# Altium schematic sheet Headers.SchDoc: Skipper Headers
size 297 x 210 mm; Author: Jack Herron; SheetNumber: 4; SheetTotal: 11
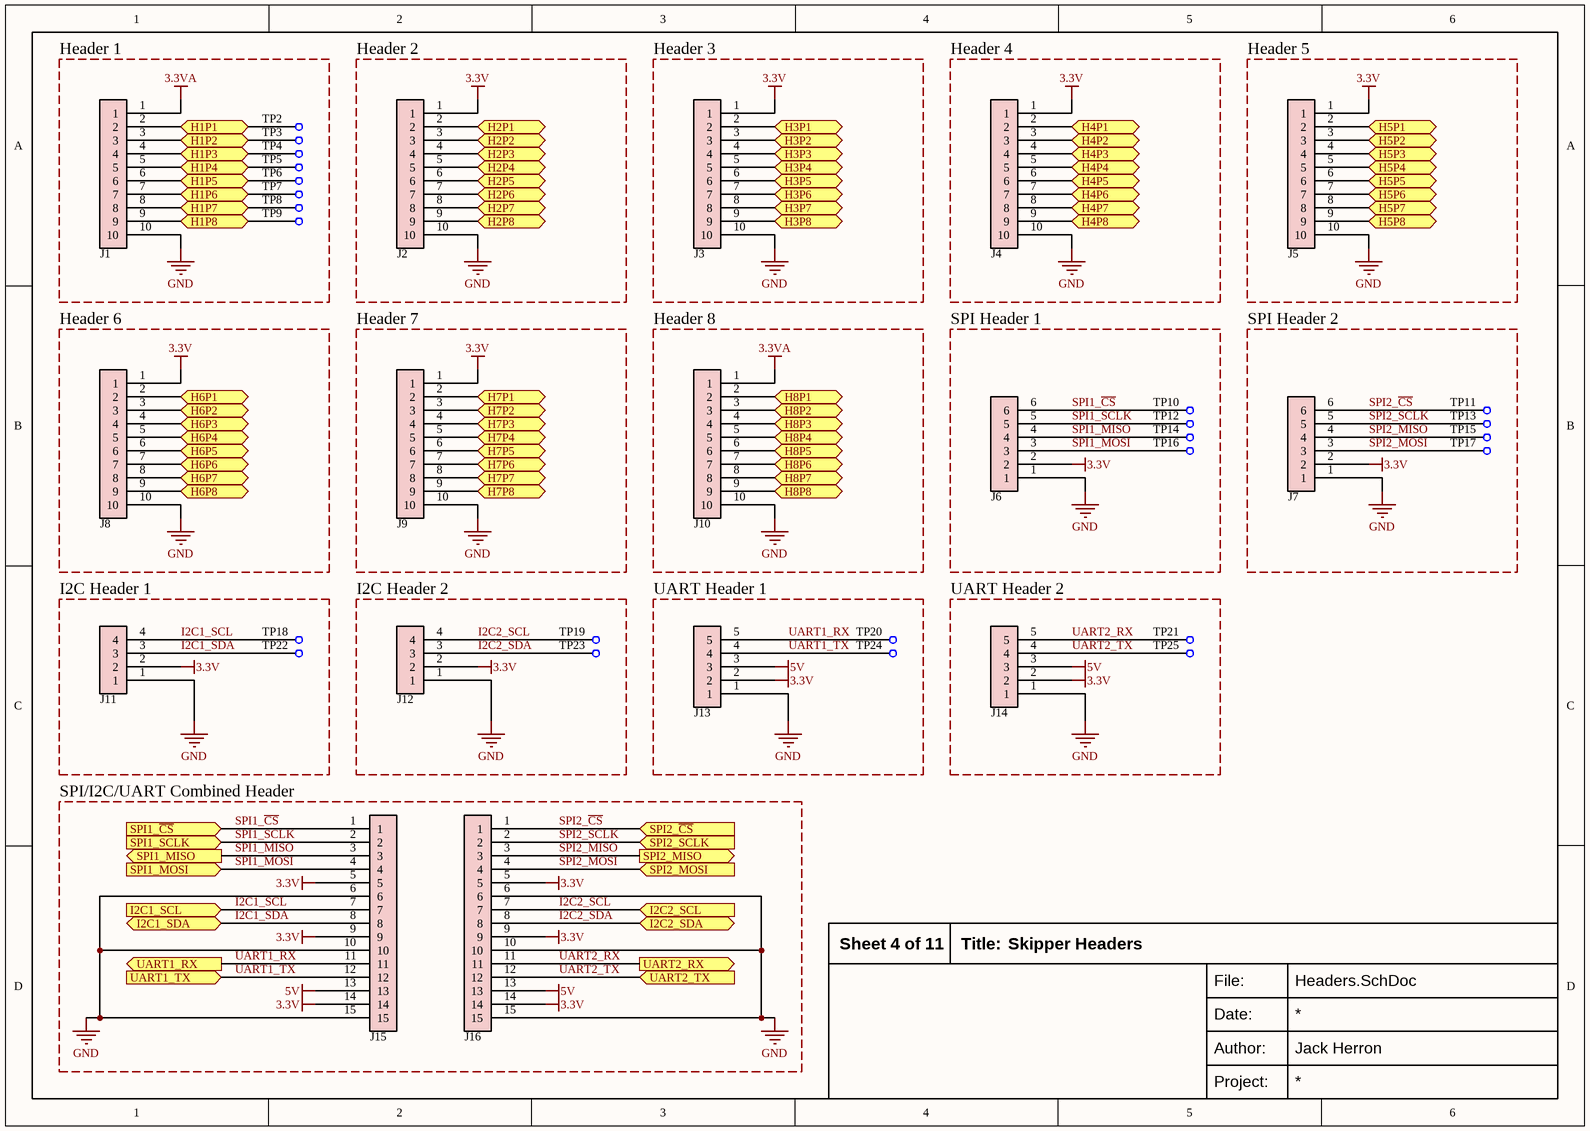
[diagram p0: Headers.SchDoc]

## Parts
J1  PM254-1-10-Z-8.5  [CONNECTOR_Female-header_1x10_2.54mm_PM254-1-10-Z-8.5_NOSILK]  (value not drawn)
J2  PM254-1-10-Z-8.5  [CONNECTOR_Female-header_1x10_2.54mm_PM254-1-10-Z-8.5_NOSILK]  (value not drawn)
J3  PM254-1-10-Z-8.5  [CONNECTOR_Female-header_1x10_2.54mm_PM254-1-10-Z-8.5_NOSILK]  (value not drawn)
J4  PM254-1-10-Z-8.5  [CONNECTOR_Female-header_1x10_2.54mm_PM254-1-10-Z-8.5_NOSILK]  (value not drawn)
J5  PM254-1-10-Z-8.5  [CONNECTOR_Female-header_1x10_2.54mm_PM254-1-10-Z-8.5_NOSILK]  (value not drawn)
J6  Connector - 6pin - 1mm  [CONNECTOR_HC-1.0-6PLT]  (value not drawn)
J7  Connector - 6pin - 1mm  [CONNECTOR_HC-1.0-6PLT]  (value not drawn)
J8  PM254-1-10-Z-8.5  [CONNECTOR_Female-header_1x10_2.54mm_PM254-1-10-Z-8.5_NOSILK]  (value not drawn)
J9  PM254-1-10-Z-8.5  [CONNECTOR_Female-header_1x10_2.54mm_PM254-1-10-Z-8.5_NOSILK]  (value not drawn)
J10  PM254-1-10-Z-8.5  [CONNECTOR_Female-header_1x10_2.54mm_PM254-1-10-Z-8.5_NOSILK]  (value not drawn)
J11  Connector - 4pin - 1mm  [CONNECTOR_HC-1.0-4PLT]  (value not drawn)
J12  Connector - 4pin - 1mm  [CONNECTOR_HC-1.0-4PLT]  (value not drawn)
J13  Connector - 5pin - 1mm  [CONNECTOR_HC-1.0-5PLT]  (value not drawn)
J14  Connector - 5pin - 1mm  [CONNECTOR_HC-1.0-5PLT]  (value not drawn)
J15  PM254-1-15-Z-8.5  [CONNECTOR_PM254-1-15-Z-8.5]  (value not drawn)
J16  PM254-1-15-Z-8.5  [CONNECTOR_PM254-1-15-Z-8.5]  (value not drawn)
TP2  RH-5019  [TESTPOINT_RH-5019]  (value not drawn)
TP3  RH-5019  [TESTPOINT_RH-5019]  (value not drawn)
TP4  RH-5019  [TESTPOINT_RH-5019]  (value not drawn)
TP5  RH-5019  [TESTPOINT_RH-5019]  (value not drawn)
TP6  RH-5019  [TESTPOINT_RH-5019]  (value not drawn)
TP7  RH-5019  [TESTPOINT_RH-5019]  (value not drawn)
TP8  RH-5019  [TESTPOINT_RH-5019]  (value not drawn)
TP9  RH-5019  [TESTPOINT_RH-5019]  (value not drawn)
TP10  RH-5019  [TESTPOINT_RH-5019]  (value not drawn)
TP11  RH-5019  [TESTPOINT_RH-5019]  (value not drawn)
TP12  RH-5019  [TESTPOINT_RH-5019]  (value not drawn)
TP13  RH-5019  [TESTPOINT_RH-5019]  (value not drawn)
TP14  RH-5019  [TESTPOINT_RH-5019]  (value not drawn)
TP15  RH-5019  [TESTPOINT_RH-5019]  (value not drawn)
TP16  RH-5019  [TESTPOINT_RH-5019]  (value not drawn)
TP17  RH-5019  [TESTPOINT_RH-5019]  (value not drawn)
TP18  RH-5019  [TESTPOINT_RH-5019]  (value not drawn)
TP19  RH-5019  [TESTPOINT_RH-5019]  (value not drawn)
TP20  RH-5019  [TESTPOINT_RH-5019]  (value not drawn)
TP21  RH-5019  [TESTPOINT_RH-5019]  (value not drawn)
TP22  RH-5019  [TESTPOINT_RH-5019]  (value not drawn)
TP23  RH-5019  [TESTPOINT_RH-5019]  (value not drawn)
TP24  RH-5019  [TESTPOINT_RH-5019]  (value not drawn)
TP25  RH-5019  [TESTPOINT_RH-5019]  (value not drawn)

## Blocks framed on the sheet
Header 1: J1 TP2-TP9
Header 2: J2
Header 3: J3
Header 4: J4
Header 5: J5
Header 6: J8
Header 7: J9
Header 8: J10
SPI Header 1: J6 TP10 TP12 TP14 TP16
SPI Header 2: J7 TP11 TP13 TP15 TP17
I2C Header 1: J11 TP18 TP22
I2C Header 2: J12 TP19 TP23
UART Header 1: J13 TP20 TP24
UART Header 2: J14 TP21 TP25
SPI/I2C/UART Combined Header: J15 J16

## Ports
H1P1 (bidir, see Top_Sheet[2A]), H1P2 (bidir, see Top_Sheet[2A]), H1P3 (bidir, see Top_Sheet[2A]), H1P4 (bidir, see Top_Sheet[3A]), H1P5 (bidir, see Top_Sheet[3A]), H1P6 (bidir, see Top_Sheet[3A]), H1P7 (bidir, see Top_Sheet[3A]), H1P8 (bidir, see Top_Sheet[3A]), H2P1 (bidir, see Top_Sheet[3A]), H2P2 (bidir, see Top_Sheet[3A]), H2P3 (bidir, see Top_Sheet[3A]), H2P4 (bidir, see Top_Sheet[3A]), H2P5 (bidir, see Top_Sheet[3A]), H2P6 (bidir, see Top_Sheet[3A]), H2P7 (bidir, see Top_Sheet[3A]), H2P8 (bidir, see Top_Sheet[3A]), H3P1 (bidir, see Top_Sheet[3A]), H3P2 (bidir, see Top_Sheet[3A]), H3P3 (bidir, see Top_Sheet[3A]), H3P4 (bidir, see Top_Sheet[3A]), H3P5 (bidir, see Top_Sheet[3A]), H3P6 (bidir, see Top_Sheet[4A]), H3P7 (bidir, see Top_Sheet[4A]), H3P8 (bidir, see Top_Sheet[4A]), H4P1 (bidir, see Top_Sheet[4A]), H4P2 (bidir, see Top_Sheet[4A]), H4P3 (bidir, see Top_Sheet[4A]), H4P4 (bidir, see Top_Sheet[4A]), H4P5 (bidir, see Top_Sheet[4A]), H4P6 (bidir, see Top_Sheet[4A]), H4P7 (bidir, see Top_Sheet[4A]), H4P8 (bidir, see Top_Sheet[4A]), H5P1 (bidir, see Top_Sheet[4A]), H5P2 (bidir, see Top_Sheet[4A]), H5P3 (bidir, see Top_Sheet[4A]), H5P4 (bidir, see Top_Sheet[4A]), H5P5 (bidir, see Top_Sheet[4A]), H5P6 (bidir, see Top_Sheet[4A]), H5P7 (bidir, see Top_Sheet[5A]), H5P8 (bidir, see Top_Sheet[5A]), H6P1 (bidir, see Top_Sheet[5A]), H6P2 (bidir, see Top_Sheet[5A]), H6P3 (bidir, see Top_Sheet[5A]), H6P4 (bidir, see Top_Sheet[5A]), H6P5 (bidir, see Top_Sheet[5A]), H6P6 (bidir, see Top_Sheet[5A]), H6P7 (bidir, see Top_Sheet[5A]), H6P8 (bidir, see Top_Sheet[5A]), H7P1 (bidir, see Top_Sheet[5A]), H7P2 (bidir, see Top_Sheet[5A]), H7P3 (bidir, see Top_Sheet[5A]), H7P4 (bidir, see Top_Sheet[5A]), H7P5 (bidir, see Top_Sheet[5A]), H7P6 (bidir, see Top_Sheet[5A]), H7P7 (bidir, see Top_Sheet[5A]), H7P8 (bidir, see Top_Sheet[5A]), H8P1 (bidir, see Top_Sheet[6A]), H8P2 (bidir, see Top_Sheet[6A]), H8P3 (bidir, see Top_Sheet[6A]), H8P4 (bidir, see Top_Sheet[6A]), H8P5 (bidir, see Top_Sheet[6A]), H8P6 (bidir, see Top_Sheet[6A]), H8P7 (bidir, see Top_Sheet[6A]), H8P8 (bidir, see Top_Sheet[6A]), I2C1_SCL (in, see Top_Sheet[1A], MCU_IO[4D]), I2C1_SDA (bidir, see Top_Sheet[1A], MCU_IO[4D]), I2C2_SCL (in, see Top_Sheet[1A], MCU_IO[6D]), I2C2_SDA (bidir, see Top_Sheet[1A], MCU_IO[6D]), SPI1_MISO (out, see Top_Sheet[2A], MCU_IO[3C]), SPI1_MOSI (in, see Top_Sheet[2A], MCU_IO[1C]), SPI1_SCLK (in, see Top_Sheet[2A], MCU_IO[3C]), SPI1_~{CS} (in, see Top_Sheet[2A], MCU_IO[6A]), SPI2_MISO (out, see Top_Sheet[2A], MCU_IO[1B]), SPI2_MOSI (in, see Top_Sheet[2A], MCU_IO[1B]), SPI2_SCLK (in, see Top_Sheet[2A], MCU_IO[1B]), SPI2_~{CS} (in, see Top_Sheet[2A], MCU_IO[6B]), UART1_RX (out, see Top_Sheet[2A], MCU_IO[1A]), UART1_TX (in, see Top_Sheet[2A], MCU_IO[1A]), UART2_RX (out, see Top_Sheet[2A], MCU_IO[1C]), UART2_TX (in, see Top_Sheet[2A], MCU_IO[1C])

## Nets
3.3V: J2.1 J3.1 J4.1 J5.1 J6.2 J7.2 J8.1 J9.1 J11.2 J12.2 J13.2 J14.2 J15.5 J15.9 J15.14 J16.5 J16.9 J16.14
3.3VA: J1.1 J10.1
5V: J13.3 J14.3 J15.13 J16.13
GND: J1.10 J2.10 J3.10 J4.10 J5.10 J6.1 J7.1 J8.10 J9.10 J10.10 J11.1 J12.1 J13.1 J14.1 J15.6 J15.10 J15.15 J16.6 J16.10 J16.15
H1P1: J1.2 TP2.1 ; port H1P1
H1P2: J1.3 TP3.1 ; port H1P2
H1P3: J1.4 TP4.1 ; port H1P3
H1P4: J1.5 TP5.1 ; port H1P4
H1P5: J1.6 TP6.1 ; port H1P5
H1P6: J1.7 TP7.1 ; port H1P6
H1P7: J1.8 TP8.1 ; port H1P7
H1P8: J1.9 TP9.1 ; port H1P8
H2P1: J2.2 ; port H2P1
H2P2: J2.3 ; port H2P2
H2P3: J2.4 ; port H2P3
H2P4: J2.5 ; port H2P4
H2P5: J2.6 ; port H2P5
H2P6: J2.7 ; port H2P6
H2P7: J2.8 ; port H2P7
H2P8: J2.9 ; port H2P8
H3P1: J3.2 ; port H3P1
H3P2: J3.3 ; port H3P2
H3P3: J3.4 ; port H3P3
H3P4: J3.5 ; port H3P4
H3P5: J3.6 ; port H3P5
H3P6: J3.7 ; port H3P6
H3P7: J3.8 ; port H3P7
H3P8: J3.9 ; port H3P8
H4P1: J4.2 ; port H4P1
H4P2: J4.3 ; port H4P2
H4P3: J4.4 ; port H4P3
H4P4: J4.5 ; port H4P4
H4P5: J4.6 ; port H4P5
H4P6: J4.7 ; port H4P6
H4P7: J4.8 ; port H4P7
H4P8: J4.9 ; port H4P8
H5P1: J5.2 ; port H5P1
H5P2: J5.3 ; port H5P2
H5P3: J5.4 ; port H5P3
H5P4: J5.5 ; port H5P4
H5P5: J5.6 ; port H5P5
H5P6: J5.7 ; port H5P6
H5P7: J5.8 ; port H5P7
H5P8: J5.9 ; port H5P8
H6P1: J8.2 ; port H6P1
H6P2: J8.3 ; port H6P2
H6P3: J8.4 ; port H6P3
H6P4: J8.5 ; port H6P4
H6P5: J8.6 ; port H6P5
H6P6: J8.7 ; port H6P6
H6P7: J8.8 ; port H6P7
H6P8: J8.9 ; port H6P8
H7P1: J9.2 ; port H7P1
H7P2: J9.3 ; port H7P2
H7P3: J9.4 ; port H7P3
H7P4: J9.5 ; port H7P4
H7P5: J9.6 ; port H7P5
H7P6: J9.7 ; port H7P6
H7P7: J9.8 ; port H7P7
H7P8: J9.9 ; port H7P8
H8P1: J10.2 ; port H8P1
H8P2: J10.3 ; port H8P2
H8P3: J10.4 ; port H8P3
H8P4: J10.5 ; port H8P4
H8P5: J10.6 ; port H8P5
H8P6: J10.7 ; port H8P6
H8P7: J10.8 ; port H8P7
H8P8: J10.9 ; port H8P8
I2C1_SCL: J11.4 J15.7 TP18.1 ; port I2C1_SCL
I2C1_SDA: J11.3 J15.8 TP22.1 ; port I2C1_SDA
I2C2_SCL: J12.4 J16.7 TP19.1 ; port I2C2_SCL
I2C2_SDA: J12.3 J16.8 TP23.1 ; port I2C2_SDA
SPI1_~{CS}: J6.6 J15.1 TP10.1 ; port SPI1_~{CS}
SPI1_MISO: J6.4 J15.3 TP14.1 ; port SPI1_MISO
SPI1_MOSI: J6.3 J15.4 TP16.1 ; port SPI1_MOSI
SPI1_SCLK: J6.5 J15.2 TP12.1 ; port SPI1_SCLK
SPI2_~{CS}: J7.6 J16.1 TP11.1 ; port SPI2_~{CS}
SPI2_MISO: J7.4 J16.3 TP15.1 ; port SPI2_MISO
SPI2_MOSI: J7.3 J16.4 TP17.1 ; port SPI2_MOSI
SPI2_SCLK: J7.5 J16.2 TP13.1 ; port SPI2_SCLK
UART1_RX: J13.5 J15.11 TP20.1 ; port UART1_RX
UART1_TX: J13.4 J15.12 TP24.1 ; port UART1_TX
UART2_RX: J14.5 J16.11 TP21.1 ; port UART2_RX
UART2_TX: J14.4 J16.12 TP25.1 ; port UART2_TX

## Notes on the sheet
- Title:
- File:
- Date:
- Project:
- Author:

## Library data of the parts
J1-J5 J8-J10 = CONNECTOR_Female-header_1x10_2.54mm_PM254-1-10-Z-8.5_NOSILK: Header - 1x10 - 2.54mm; Manufacturer 1: HCTL; Manufacturer Part Number 1: PM254-1-10-Z-8.5; Supplier 1: LCSC; Supplier Part Number 1: C2897373
J6 J7 = CONNECTOR_HC-1.0-6PLT: Manufacturer 1: HCTL; Manufacturer Part Number 1: HC-1.0-6PLT; Supplier 1: LCSC; Supplier Part Number 1: C2845374
J11 J12 = CONNECTOR_HC-1.0-4PLT: Manufacturer 1: HCTL; Manufacturer Part Number 1: HC-1.0-4PLT; Supplier 1: LCSC; Supplier Part Number 1: C2845372
J13 J14 = CONNECTOR_HC-1.0-5PLT: Manufacturer 1: HCTL; Manufacturer Part Number 1: HC-1.0-5PLT; Supplier 1: LCSC; Supplier Part Number 1: C2845373
J15 J16 = CONNECTOR_PM254-1-15-Z-8.5: 1x15 2.54mm Female Header; Manufacturer 1: HCTL; Manufacturer Part Number 1: PM254-1-15-Z-8.5; Supplier 1: LCSC; Supplier Part Number 1: C2897378
TP2-TP25 = TESTPOINT_RH-5019: SMD testpoint; Manufacturer 1: ronghe; Manufacturer Part Number 1: RH-5019; Supplier 1: LCSC; Supplier Part Number 1: C5199800